# Altium project GTV4.0-V16_Lite.PrjPcb (part 9 of 9)

## Sheet GSM_Sheet.SchDoc
size 420 x 297 mm
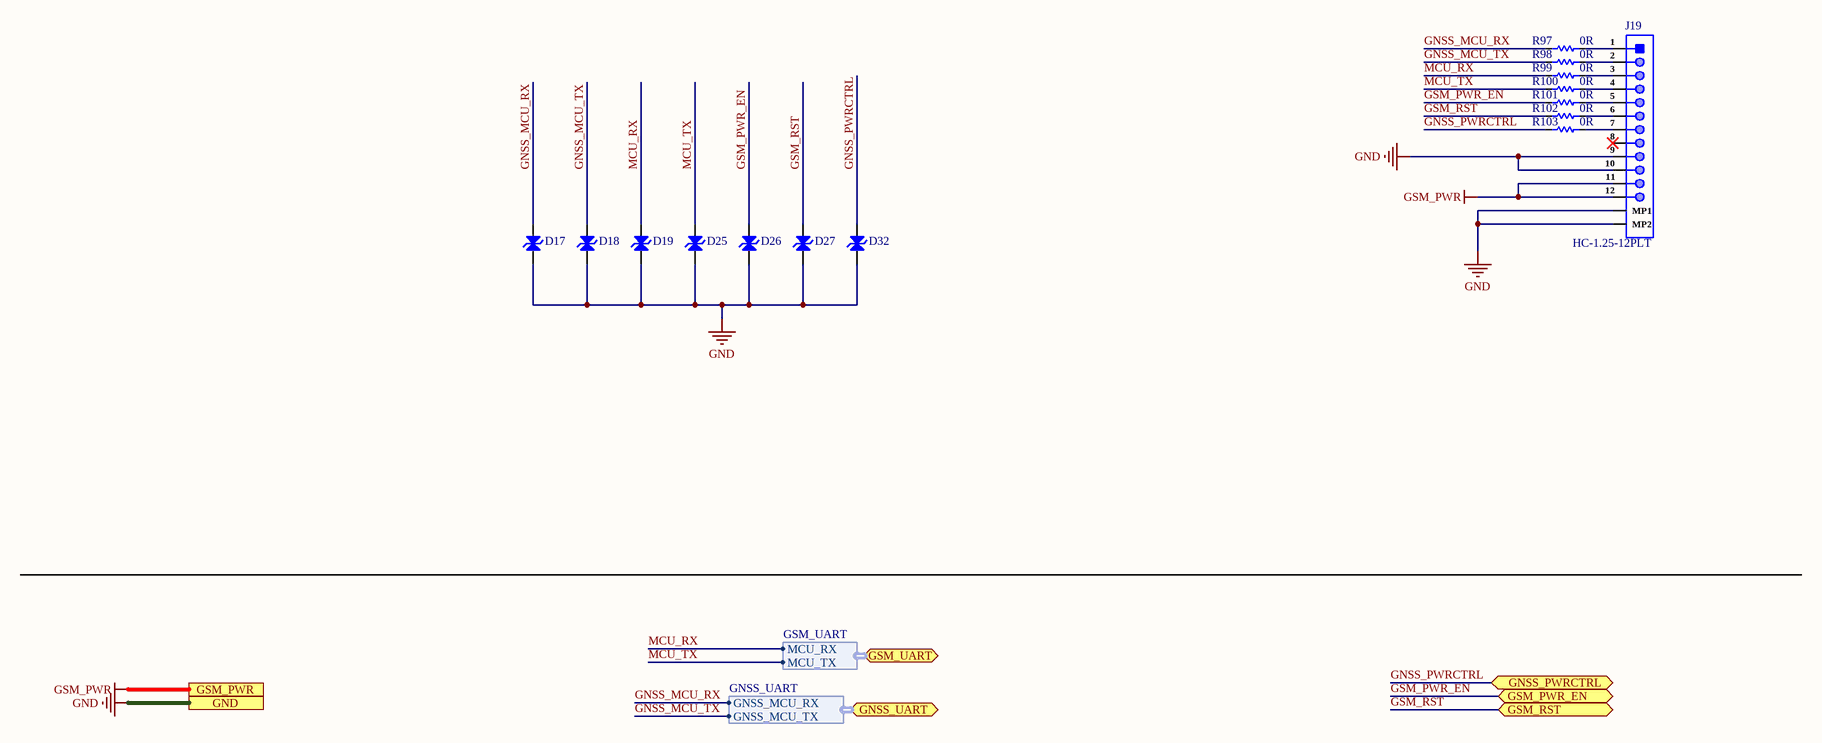
[diagram p11: GSM_Sheet.SchDoc]

### Parts
D17  LESD8D3.3CAT5G  [SOD-882 Bi Directional]  (value not drawn)
D18  LESD8D3.3CAT5G  [SOD-882 Bi Directional]  (value not drawn)
D19  LESD8D3.3CAT5G  [SOD-882 Bi Directional]  (value not drawn)
D25  LESD8D3.3CAT5G  [SOD-882 Bi Directional]  (value not drawn)
D26  LESD8D3.3CAT5G  [SOD-882 Bi Directional]  (value not drawn)
D27  LESD8D3.3CAT5G  [SOD-882 Bi Directional]  (value not drawn)
D32  LESD8D3.3CAT5G  [SOD-882 Bi Directional]  (value not drawn)
J19  HC-1.25-12PLT  [HC-1.25-12PLT]
R97  0R  [Res-0603]
R98  0R  [Res-0603]
R99  0R  [Res-0603]
R100  0R  [Res-0603]
R101  0R  [Res-0603]
R102  0R  [Res-0603]
R103  0R  [Res-0603]

### Ports
GND, GNSS_PWRCTRL (bidir), GNSS_UART (bidir, harness GNSS_UART), GSM_PWR, GSM_PWR_EN (bidir), GSM_RST (bidir), GSM_UART (bidir, harness GSM_UART)

### Harnesses
GSM_UART: MCU_RX, MCU_TX
GNSS_UART: GNSS_MCU_RX, GNSS_MCU_TX

### Nets
GND: D17.1(A) D18.1(A) D19.1(A) D25.1(A) D26.1(A) D27.1(A) D32.1(A) J19.9 J19.10 J19.MP1 J19.MP2 ; port GND
GSM_PWR: J19.11 J19.12 ; port GSM_PWR
GNSS_MCU_RX: D17.2(A) R97.1 ; port GNSS_UART.GNSS_MCU_RX
GNSS_MCU_TX: D18.2(A) R98.1 ; port GNSS_UART.GNSS_MCU_TX
GNSS_PWRCTRL: D32.2(A) R103.1 ; port GNSS_PWRCTRL
GSM_PWR_EN: D26.2(A) R101.1 ; port GSM_PWR_EN
GSM_RST: D27.2(A) R102.1 ; port GSM_RST
MCU_RX: D19.2(A) R99.1 ; port GSM_UART.MCU_RX
MCU_TX: D25.2(A) R100.1 ; port GSM_UART.MCU_TX
NetJ19_1: J19.1 R97.2
NetJ19_2: J19.2 R98.2
NetJ19_3: J19.3 R99.2
NetJ19_4: J19.4 R100.2
NetJ19_5: J19.5 R101.2
NetJ19_6: J19.6 R102.2
NetJ19_7: J19.7 R103.2

Not connected (* = marked no-connect by the designer): J19 8*

### Notes on the sheet
- File:
- Title:
- Date:
- Page
- Num:
- Total:
- Drawn By: Huzaifa Ali

### Library data of the parts
D17-D19 D25-D27 D32 = LESD8D3.3CAT5G: as D20-D24 on sheet SD-Card-Sheet; Manufacturer Part Number: LESD8D3.3CAT5G; Package: SOD-882; LCSC Part Number: C172409; Item Type: Protection Device; ComponentLink1Description: LCSC; ComponentLink1URL: https://www.lcsc.com/product-detail/span-style-background-color-ff0-ESD-span-Protection-Devices_LRC-LESD8D3-3CAT5G_C172409.html
J19 = HC-1.25-12PLT: 1x12P 12P PicoBlade(MX 1.25) Tin 12 -25℃~+85℃ 2A 1 1.25mm Brass Surface Mount,Vertical SMD,P=1.25mm Wire To Board Connector ROHS; Manufacturer: HCTL; Manufacturer Part Number: HC-1.25-12PLT; Package: SMD,P=1.25mm; LCSC Part Number: C2937190; Item Type: Wire To Board Connector; ComponentLink1Description: LCSC; ComponentLink1URL: https://lcsc.com/product-detail/Wire-To-Board-Connector_HCTL-HC-1-25-12PLT_C2937190.html?s_z=n_1.25-12plt
R97-R103 = RC0603JR-070RL: RES 0 OHM JUMPER 1/10W 0603; Manufacturer: Yageo; Resistance: 0mR; Tolerance: 1%; Power Rating: 100mW; Voltage Rating (DC): 50V; Temperature Coefficient: 200ppm/°C; Resistance Tolerance: 5%; Item Type: Resistor; Supplier 1: Digi-Key; Manufacturer Part Number: RC0603JR-070RL; RoHS: Yes; Category: Chip SMD Resistors; Stock 1: 18081776; Pricing 1: 1=0.10000, 10=0.01700, 25=0.01240, 50=0.00960, 100=0.00700, 250=0.00536, 500=0.00430, 1000=0.00316 (USD); Case/Package: 0603; Number of Pins: 2; Contact Plating: Tin,Matte; Case Code (Imperial): 0603; Case Code (Metric): 1608; Size Code: 0603; Min Operating Temperature: -55°C; Max Operating Temperature: 155°C; Resistor Type: Thick Film; Packaging: Tape and Reel; Termination: SMD/SMT; Series: RC; Technology: THICK FILM; Package Quantity: 5000; Voltage Rating: 50V; Features: Moisture Resistant; Max Power Dissipation: 100mW; Number of Terminations: 2; Construction: Rectangular; Length: 1.6mm; Width: 0.8mm; Height: 0.45mm; Depth: 0.8mm; Radiation Hardening: No; Reach SVHC Compliant: No SVHC; Lead Free: Lead Free; RoHS Compliant: Yes; Military Standard: Not; Supplier Part Number 1: 311-0.0GRCT-ND; LCSC Part Number: C95177

## Nets that join several sheets
3V3: Regulator_Section (5 pins), Onboard_Sensor_Section (9 pins), SD-Card-Sheet (8 pins)
3V3_MCU: Regulator_Section (8 pins), Controller_Section (33 pins), LED_Section (Q26.1 R73.1)
5V: Current_Sense_Section (6 pins), Regulator_Section (11 pins), Gate_Driver_Section (6 pins), Onboard_Sensor_Section (J7.1 R35.1 SB8.2), WIFI_Display_Sheet (R127.2 R135.1 U22.3)
5V-LED: Regulator_Section (5 pins), LED_Section (J18.3 R74.1)
GND: Reverse Protection_Section (5 pins), Voltage_Monitoring_Section (5 pins), Current_Sense_Section (12 pins), Regulator_Section (41 pins), Controller_Section (38 pins), Gate_Driver_Section (9 pins), Heater_Section (6 pins), LED_Section (J18.1 Q4.2 R44.1), Onboard_Sensor_Section (29 pins), WIFI_Display_Sheet (8 pins), SD-Card-Sheet (13 pins), GSM_Sheet (11 pins)
GSM_PWR: Regulator_Section (20 pins), WIFI_Display_Sheet (R134.1 R137.2 U22.6), GSM_Sheet (J19.11 J19.12)
VCC: Controller_Section (R12.2), Heater_Section (C24.1 C25.2 Q7.2), LED_Section (J10.1), Onboard_Sensor_Section (SB10.2), WIFI_Display_Sheet (J13.12)
VCC#12: Voltage_Monitoring_Section (Q32.3 R34.2 SB11.1), Regulator_Section (D11.2)
VCC#P: Reverse Protection_Section (9 pins), Voltage_Monitoring_Section (SB9.2), Current_Sense_Section (U1.3 U1.4 U2.3 U2.4)
ADDR-LED: Controller_Section (U21.65), LED_Section (Q26.2 R73.2)
BACKUP: Regulator_Section (C123.2 R162.1 R163.2), Controller_Section (U21.124)
BOOT0: Controller_Section (R16.1 U21.138), WIFI_Display_Sheet (J13.3)
BUZZER: Controller_Section (U21.82), Onboard_Sensor_Section (R6.1)
CLK: Controller_Section (U21.74), SD-Card-Sheet (D22.2 J30.5 R158.1)
CMD: Controller_Section (U21.76), SD-Card-Sheet (D21.2 J30.3 R157.1)
DAT0: Controller_Section (U21.75), SD-Card-Sheet (D23.2 J30.7 R159.1)
DAT3: Controller_Section (U21.73), SD-Card-Sheet (D20.2 J30.2 R156.1)
ENA: Controller_Section (U21.7), Gate_Driver_Section (U11.2)
GNSS_MCU_RX: Controller_Section (U21.97), GSM_Sheet (D17.2 R97.1)
GNSS_MCU_TX: Controller_Section (U21.96), GSM_Sheet (D18.2 R98.1)
GNSS_PWRCTRL: Controller_Section (U21.12), GSM_Sheet (D32.2 R103.1)
GSM_PWR_EN: Controller_Section (U21.141), GSM_Sheet (D26.2 R101.1)
GSM_RST: Controller_Section (U21.142), GSM_Sheet (D27.2 R102.1)
HEAT_1_CNTRL: Controller_Section (U21.92), Heater_Section (R18.1)
INA_1: Controller_Section (U21.59), Gate_Driver_Section (U8.2)
INB_1: Controller_Section (U21.60), Gate_Driver_Section (U10.2)
IP+_1: Current_Sense_Section (U1.1 U1.2), Gate_Driver_Section (D9.2 J3.1)
IP+_2: Current_Sense_Section (U2.1 U2.2), Gate_Driver_Section (D10.2 J4.1)
MCU_RX: Controller_Section (U21.102), GSM_Sheet (D19.2 R99.1)
MCU_TX: Controller_Section (U21.101), GSM_Sheet (D25.2 R100.1)
MicroSD_DET: Controller_Section (U21.140), SD-Card-Sheet (D24.2 J30.SW-A R160.1)
NRST: Controller_Section (C73.2 SW3.3 U21.25), Onboard_Sensor_Section (J1.10), WIFI_Display_Sheet (J13.4)
PIR_OUT: Controller_Section (U21.99), Onboard_Sensor_Section (R9.1)
PS_MCU: Controller_Section (U21.80), Onboard_Sensor_Section (D3.2 D12.2 SB4.1 SB13.1)
PWM_D2: Controller_Section (U21.81), Onboard_Sensor_Section (Q3.3 R20.2)
READY: Regulator_Section (R161.1 U5.3), Controller_Section (U21.125)
SHDN: Reverse Protection_Section (R32.1 SB7.1), Controller_Section (U21.14)
SNS_IN: Controller_Section (U21.100), Onboard_Sensor_Section (SB1.1)
SWCLK: Controller_Section (U21.109), Onboard_Sensor_Section (J1.4)
SWDIO: Controller_Section (U21.105), Onboard_Sensor_Section (J1.2)
TEMP_SNS: Controller_Section (R31.2 U21.64), Onboard_Sensor_Section (J5.2)
USB_D_N: Controller_Section (U21.103), Onboard_Sensor_Section (D4.2 J7.2)
USB_D_P: Controller_Section (U21.104), Onboard_Sensor_Section (D4.1 J7.3)
VIOUT1: Current_Sense_Section (C11.1 R5.2 R7.1), Controller_Section (U21.28)
VIOUT2: Current_Sense_Section (C19.1 R8.2 R10.1), Controller_Section (U21.29)
W_LED_CNTRL: Controller_Section (U21.68), LED_Section (R44.2 R124.1)
WIFI_RX1: Controller_Section (U21.36), WIFI_Display_Sheet (J13.2)
WIFI_TX1: Controller_Section (U21.37), WIFI_Display_Sheet (J13.1)